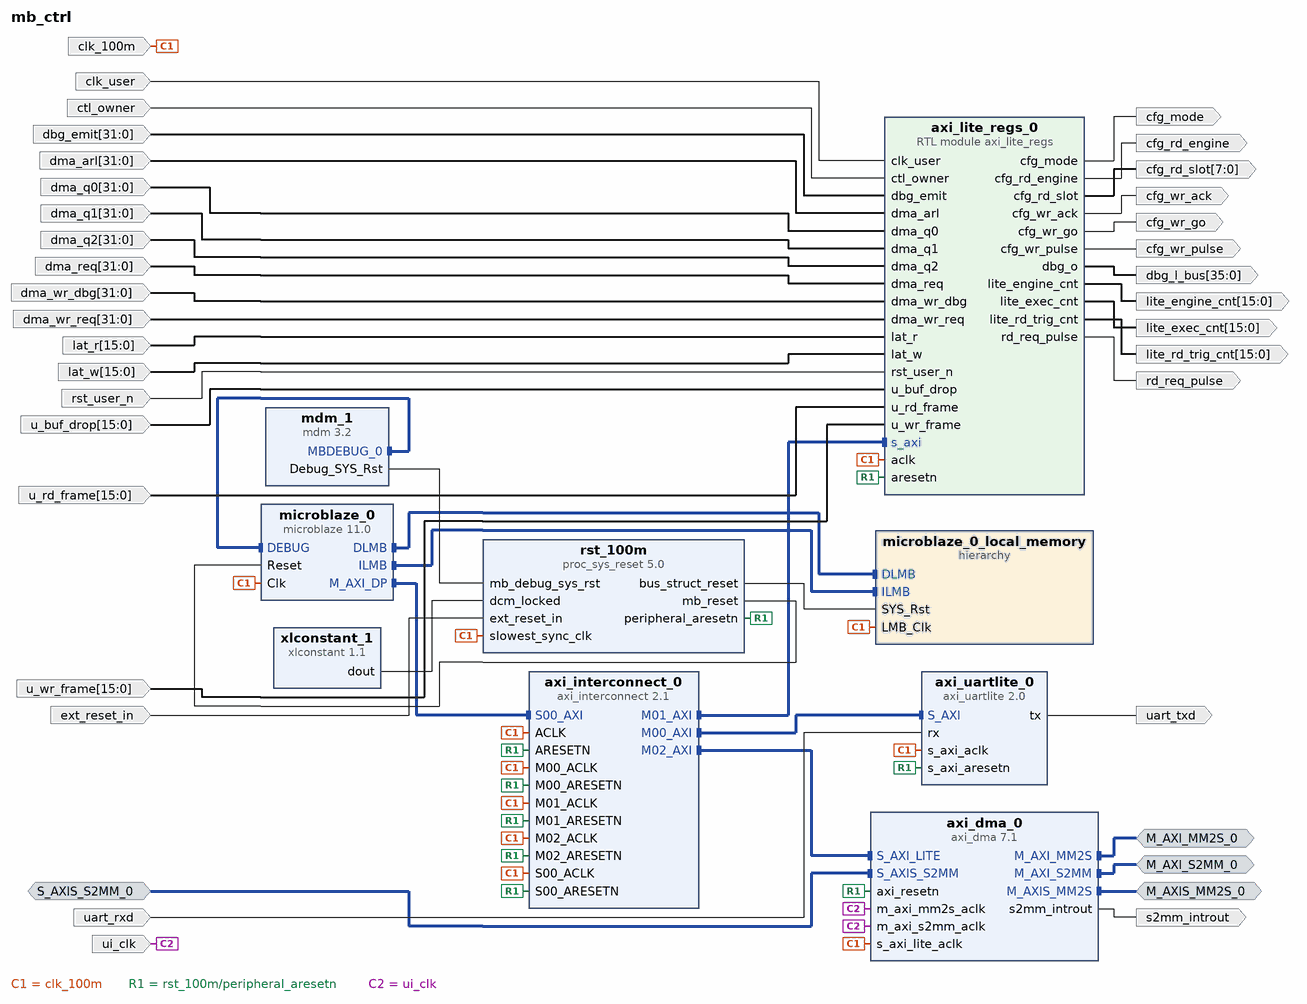
[diagram p0: block diagram of the top level]
# Vivado block design mb_ctrl, xcku060-ffva1156-2-i, Vivado 2023.1
create_bd_design mb_ctrl

create_bd_intf_port -mode Master -vlnv xilinx.com:interface:aximm_rtl:1.0 M_AXI_MM2S_0
set_property -dict [list \
  CONFIG.ADDR_WIDTH 32 \
  CONFIG.DATA_WIDTH 512 \
  CONFIG.FREQ_HZ 300000000 \
  CONFIG.HAS_BRESP 0 \
  CONFIG.HAS_BURST 0 \
  CONFIG.HAS_LOCK 0 \
  CONFIG.HAS_QOS 0 \
  CONFIG.HAS_REGION 0 \
  CONFIG.HAS_WSTRB 0 \
  CONFIG.NUM_READ_OUTSTANDING 16 \
  CONFIG.NUM_WRITE_OUTSTANDING 2 \
  CONFIG.PROTOCOL AXI4 \
  CONFIG.READ_WRITE_MODE READ_ONLY \
] [get_bd_intf_ports M_AXI_MM2S_0]
create_bd_intf_port -mode Master -vlnv xilinx.com:interface:axis_rtl:1.0 M_AXIS_MM2S_0
set_property -dict {CONFIG.FREQ_HZ 300000000} [get_bd_intf_ports M_AXIS_MM2S_0]
create_bd_intf_port -mode Master -vlnv xilinx.com:interface:aximm_rtl:1.0 M_AXI_S2MM_0
set_property -dict [list \
  CONFIG.ADDR_WIDTH 32 \
  CONFIG.DATA_WIDTH 512 \
  CONFIG.FREQ_HZ 300000000 \
  CONFIG.HAS_BURST 0 \
  CONFIG.HAS_LOCK 0 \
  CONFIG.HAS_QOS 0 \
  CONFIG.HAS_REGION 0 \
  CONFIG.HAS_RRESP 0 \
  CONFIG.NUM_READ_OUTSTANDING 2 \
  CONFIG.NUM_WRITE_OUTSTANDING 16 \
  CONFIG.PROTOCOL AXI4 \
  CONFIG.READ_WRITE_MODE WRITE_ONLY \
] [get_bd_intf_ports M_AXI_S2MM_0]
create_bd_intf_port -mode Slave -vlnv xilinx.com:interface:axis_rtl:1.0 S_AXIS_S2MM_0
set_property -dict [list \
  CONFIG.FREQ_HZ 300000000 \
  CONFIG.HAS_TKEEP 1 \
  CONFIG.HAS_TLAST 1 \
  CONFIG.HAS_TREADY 1 \
  CONFIG.HAS_TSTRB 0 \
  CONFIG.LAYERED_METADATA undef \
  CONFIG.TDATA_NUM_BYTES 64 \
  CONFIG.TDEST_WIDTH 0 \
  CONFIG.TID_WIDTH 0 \
  CONFIG.TUSER_WIDTH 0 \
] [get_bd_intf_ports S_AXIS_S2MM_0]
create_bd_port -dir I -type clk clk_100m
set_property -dict {CONFIG.FREQ_HZ 100000000} [get_bd_ports clk_100m]
create_bd_port -dir I -type rst ext_reset_in
set_property -dict {CONFIG.POLARITY ACTIVE_HIGH} [get_bd_ports ext_reset_in]
create_bd_port -dir I uart_rxd
create_bd_port -dir O uart_txd
create_bd_port -dir I -type clk ui_clk
set_property -dict {CONFIG.FREQ_HZ 300000000} [get_bd_ports ui_clk]
create_bd_port -dir O s2mm_introut
create_bd_port -dir I clk_user
create_bd_port -dir I rst_user_n
create_bd_port -dir I -from 15 -to 0 u_wr_frame
create_bd_port -dir I -from 15 -to 0 u_rd_frame
create_bd_port -dir I -from 15 -to 0 u_buf_drop
create_bd_port -dir I ctl_owner
create_bd_port -dir O cfg_mode
create_bd_port -dir O -from 7 -to 0 cfg_rd_slot
create_bd_port -dir O rd_req_pulse
create_bd_port -dir O cfg_wr_pulse
create_bd_port -dir O -from 15 -to 0 lite_exec_cnt
create_bd_port -dir O -from 15 -to 0 lite_rd_trig_cnt
create_bd_port -dir I -from 15 -to 0 lat_w
create_bd_port -dir I -from 15 -to 0 lat_r
create_bd_port -dir I -from 31 -to 0 dma_q0
create_bd_port -dir I -from 31 -to 0 dma_q1
create_bd_port -dir I -from 31 -to 0 dma_q2
create_bd_port -dir O cfg_rd_engine
create_bd_port -dir I -from 31 -to 0 dma_req
create_bd_port -dir I -from 31 -to 0 dma_arl
create_bd_port -dir I -from 31 -to 0 dbg_emit
create_bd_port -dir O -from 15 -to 0 lite_engine_cnt
create_bd_port -dir I -from 31 -to 0 dma_wr_req
create_bd_port -dir I -from 31 -to 0 dma_wr_dbg
create_bd_port -dir O cfg_wr_go
create_bd_port -dir O cfg_wr_ack
create_bd_port -dir O -from 35 -to 0 dbg_l_bus

create_bd_cell -type ip -vlnv xilinx.com:ip:microblaze:11.0 microblaze_0
set_property -dict {CONFIG.C_DEBUG_ENABLED 1 CONFIG.C_D_AXI 1 CONFIG.C_D_LMB 1 CONFIG.C_I_LMB 1} [get_bd_cells microblaze_0]
create_bd_cell -type hier microblaze_0_local_memory
create_bd_cell -type ip -vlnv xilinx.com:ip:mdm:3.2 mdm_1
create_bd_cell -type ip -vlnv xilinx.com:ip:proc_sys_reset:5.0 rst_100m
create_bd_cell -type ip -vlnv xilinx.com:ip:xlconstant:1.1 xlconstant_1
create_bd_cell -type ip -vlnv xilinx.com:ip:axi_interconnect:2.1 axi_interconnect_0
set_property -dict {CONFIG.NUM_MI 3 CONFIG.NUM_SI 1} [get_bd_cells axi_interconnect_0]
create_bd_cell -type ip -vlnv xilinx.com:ip:axi_uartlite:2.0 axi_uartlite_0
set_property -dict {CONFIG.C_BAUDRATE 9600} [get_bd_cells axi_uartlite_0]
create_bd_cell -type module -reference axi_lite_regs axi_lite_regs_0
create_bd_cell -type ip -vlnv xilinx.com:ip:axi_dma:7.1 axi_dma_0
set_property -dict [list \
  CONFIG.c_include_mm2s 1 \
  CONFIG.c_include_s2mm 1 \
  CONFIG.c_include_sg 0 \
  CONFIG.c_m_axi_mm2s_data_width 512 \
  CONFIG.c_m_axi_s2mm_data_width 512 \
  CONFIG.c_m_axis_mm2s_tdata_width 512 \
  CONFIG.c_s_axis_s2mm_tdata_width 512 \
  CONFIG.c_sg_length_width 16 \
] [get_bd_cells axi_dma_0]

# ---- hierarchy /microblaze_0_local_memory ----
current_bd_instance /microblaze_0_local_memory
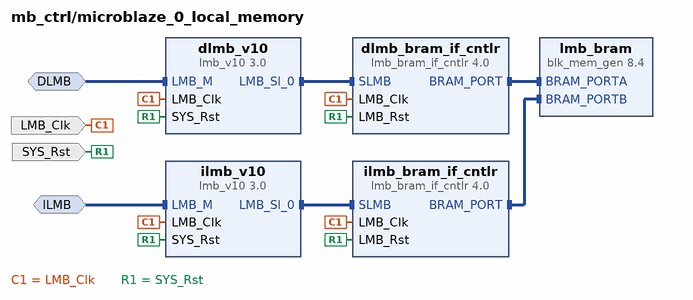
[diagram p1: block diagram inside /microblaze_0_local_memory]
create_bd_intf_pin -mode MirroredMaster -vlnv xilinx.com:interface:lmb_rtl:1.0 DLMB
create_bd_intf_pin -mode MirroredMaster -vlnv xilinx.com:interface:lmb_rtl:1.0 ILMB
create_bd_pin -dir I -type clk LMB_Clk
create_bd_pin -dir I -type rst SYS_Rst

create_bd_cell -type ip -vlnv xilinx.com:ip:lmb_v10:3.0 dlmb_v10
create_bd_cell -type ip -vlnv xilinx.com:ip:lmb_v10:3.0 ilmb_v10
create_bd_cell -type ip -vlnv xilinx.com:ip:lmb_bram_if_cntlr:4.0 dlmb_bram_if_cntlr
set_property -dict {CONFIG.C_ECC 0} [get_bd_cells dlmb_bram_if_cntlr]
create_bd_cell -type ip -vlnv xilinx.com:ip:lmb_bram_if_cntlr:4.0 ilmb_bram_if_cntlr
set_property -dict {CONFIG.C_ECC 0} [get_bd_cells ilmb_bram_if_cntlr]
create_bd_cell -type ip -vlnv xilinx.com:ip:blk_mem_gen:8.4 lmb_bram
set_property -dict {CONFIG.Memory_Type True_Dual_Port_RAM CONFIG.use_bram_block BRAM_Controller} [get_bd_cells lmb_bram]

# ---- connections ----

current_bd_instance /microblaze_0_local_memory
connect_bd_intf_net [get_bd_intf_pins dlmb_v10/LMB_M] [get_bd_intf_pins DLMB]
connect_bd_intf_net [get_bd_intf_pins dlmb_v10/LMB_Sl_0] [get_bd_intf_pins dlmb_bram_if_cntlr/SLMB]
connect_bd_intf_net [get_bd_intf_pins ilmb_v10/LMB_M] [get_bd_intf_pins ILMB]
connect_bd_intf_net [get_bd_intf_pins ilmb_v10/LMB_Sl_0] [get_bd_intf_pins ilmb_bram_if_cntlr/SLMB]
connect_bd_intf_net [get_bd_intf_pins dlmb_bram_if_cntlr/BRAM_PORT] [get_bd_intf_pins lmb_bram/BRAM_PORTA]
connect_bd_intf_net [get_bd_intf_pins ilmb_bram_if_cntlr/BRAM_PORT] [get_bd_intf_pins lmb_bram/BRAM_PORTB]
connect_bd_net [get_bd_pins LMB_Clk] \
  [get_bd_pins dlmb_v10/LMB_Clk] [get_bd_pins dlmb_bram_if_cntlr/LMB_Clk] [get_bd_pins ilmb_v10/LMB_Clk] \
  [get_bd_pins ilmb_bram_if_cntlr/LMB_Clk]
connect_bd_net [get_bd_pins SYS_Rst] \
  [get_bd_pins dlmb_v10/SYS_Rst] [get_bd_pins dlmb_bram_if_cntlr/LMB_Rst] [get_bd_pins ilmb_v10/SYS_Rst] \
  [get_bd_pins ilmb_bram_if_cntlr/LMB_Rst]
set_property HDL_ATTRIBUTE.BMM_INFO_ADDRESS_SPACE {byte  0x00000000 32 > mb_ctrl microblaze_0_local_memory/lmb_bram} [get_bd_cells dlmb_bram_if_cntlr]
set_property HDL_ATTRIBUTE.KEEP_HIERARCHY yes [get_bd_cells dlmb_bram_if_cntlr]

current_bd_instance /
connect_bd_intf_net -intf_net S_AXIS_S2MM_0_1 [get_bd_intf_ports S_AXIS_S2MM_0] [get_bd_intf_pins axi_dma_0/S_AXIS_S2MM]
connect_bd_intf_net [get_bd_intf_ports M_AXIS_MM2S_0] [get_bd_intf_pins axi_dma_0/M_AXIS_MM2S]
connect_bd_intf_net [get_bd_intf_ports M_AXI_MM2S_0] [get_bd_intf_pins axi_dma_0/M_AXI_MM2S]
connect_bd_intf_net [get_bd_intf_ports M_AXI_S2MM_0] [get_bd_intf_pins axi_dma_0/M_AXI_S2MM]
connect_bd_intf_net [get_bd_intf_pins axi_interconnect_0/M00_AXI] [get_bd_intf_pins axi_uartlite_0/S_AXI]
connect_bd_intf_net [get_bd_intf_pins axi_interconnect_0/M01_AXI] [get_bd_intf_pins axi_lite_regs_0/s_axi]
connect_bd_intf_net [get_bd_intf_pins axi_interconnect_0/M02_AXI] [get_bd_intf_pins axi_dma_0/S_AXI_LITE]
connect_bd_intf_net [get_bd_intf_pins mdm_1/MBDEBUG_0] [get_bd_intf_pins microblaze_0/DEBUG]
connect_bd_intf_net [get_bd_intf_pins microblaze_0/DLMB] [get_bd_intf_pins microblaze_0_local_memory/DLMB]
connect_bd_intf_net [get_bd_intf_pins microblaze_0/ILMB] [get_bd_intf_pins microblaze_0_local_memory/ILMB]
connect_bd_intf_net [get_bd_intf_pins microblaze_0/M_AXI_DP] [get_bd_intf_pins axi_interconnect_0/S00_AXI]
connect_bd_net [get_bd_pins axi_dma_0/s2mm_introut] [get_bd_ports s2mm_introut]
connect_bd_net [get_bd_pins axi_lite_regs_0/cfg_mode] [get_bd_ports cfg_mode]
connect_bd_net [get_bd_pins axi_lite_regs_0/cfg_rd_engine] [get_bd_ports cfg_rd_engine]
connect_bd_net [get_bd_pins axi_lite_regs_0/cfg_rd_slot] [get_bd_ports cfg_rd_slot]
connect_bd_net [get_bd_pins axi_lite_regs_0/cfg_wr_ack] [get_bd_ports cfg_wr_ack]
connect_bd_net [get_bd_pins axi_lite_regs_0/cfg_wr_go] [get_bd_ports cfg_wr_go]
connect_bd_net [get_bd_pins axi_lite_regs_0/cfg_wr_pulse] [get_bd_ports cfg_wr_pulse]
connect_bd_net [get_bd_pins axi_lite_regs_0/dbg_o] [get_bd_ports dbg_l_bus]
connect_bd_net [get_bd_pins axi_lite_regs_0/lite_engine_cnt] [get_bd_ports lite_engine_cnt]
connect_bd_net [get_bd_pins axi_lite_regs_0/lite_exec_cnt] [get_bd_ports lite_exec_cnt]
connect_bd_net [get_bd_pins axi_lite_regs_0/lite_rd_trig_cnt] [get_bd_ports lite_rd_trig_cnt]
connect_bd_net [get_bd_pins axi_lite_regs_0/rd_req_pulse] [get_bd_ports rd_req_pulse]
connect_bd_net [get_bd_pins axi_uartlite_0/tx] [get_bd_ports uart_txd]
connect_bd_net [get_bd_ports clk_100m] \
  [get_bd_pins microblaze_0/Clk] [get_bd_pins microblaze_0_local_memory/LMB_Clk] [get_bd_pins rst_100m/slowest_sync_clk] \
  [get_bd_pins axi_interconnect_0/ACLK] [get_bd_pins axi_interconnect_0/S00_ACLK] [get_bd_pins axi_interconnect_0/M00_ACLK] \
  [get_bd_pins axi_interconnect_0/M01_ACLK] [get_bd_pins axi_uartlite_0/s_axi_aclk] [get_bd_pins axi_lite_regs_0/aclk] \
  [get_bd_pins axi_interconnect_0/M02_ACLK] [get_bd_pins axi_dma_0/s_axi_lite_aclk]
connect_bd_net -net clk_user_0_1 [get_bd_ports clk_user] [get_bd_pins axi_lite_regs_0/clk_user]
connect_bd_net -net ctl_owner_0_1 [get_bd_ports ctl_owner] [get_bd_pins axi_lite_regs_0/ctl_owner]
connect_bd_net -net dbg_emit_0_1 [get_bd_ports dbg_emit] [get_bd_pins axi_lite_regs_0/dbg_emit]
connect_bd_net -net dma_arl_0_1 [get_bd_ports dma_arl] [get_bd_pins axi_lite_regs_0/dma_arl]
connect_bd_net -net dma_q0_0_1 [get_bd_ports dma_q0] [get_bd_pins axi_lite_regs_0/dma_q0]
connect_bd_net -net dma_q1_0_1 [get_bd_ports dma_q1] [get_bd_pins axi_lite_regs_0/dma_q1]
connect_bd_net -net dma_q2_0_1 [get_bd_ports dma_q2] [get_bd_pins axi_lite_regs_0/dma_q2]
connect_bd_net -net dma_req_0_1 [get_bd_ports dma_req] [get_bd_pins axi_lite_regs_0/dma_req]
connect_bd_net -net dma_wr_dbg_0_1 [get_bd_ports dma_wr_dbg] [get_bd_pins axi_lite_regs_0/dma_wr_dbg]
connect_bd_net -net dma_wr_req_0_1 [get_bd_ports dma_wr_req] [get_bd_pins axi_lite_regs_0/dma_wr_req]
connect_bd_net [get_bd_ports ext_reset_in] [get_bd_pins rst_100m/ext_reset_in]
connect_bd_net -net lat_r_0_1 [get_bd_ports lat_r] [get_bd_pins axi_lite_regs_0/lat_r]
connect_bd_net -net lat_w_0_1 [get_bd_ports lat_w] [get_bd_pins axi_lite_regs_0/lat_w]
connect_bd_net [get_bd_pins mdm_1/Debug_SYS_Rst] [get_bd_pins rst_100m/mb_debug_sys_rst]
connect_bd_net [get_bd_pins rst_100m/bus_struct_reset] [get_bd_pins microblaze_0_local_memory/SYS_Rst]
connect_bd_net [get_bd_pins rst_100m/mb_reset] [get_bd_pins microblaze_0/Reset]
connect_bd_net [get_bd_pins rst_100m/peripheral_aresetn] \
  [get_bd_pins axi_interconnect_0/ARESETN] [get_bd_pins axi_interconnect_0/S00_ARESETN] \
  [get_bd_pins axi_interconnect_0/M00_ARESETN] [get_bd_pins axi_interconnect_0/M01_ARESETN] \
  [get_bd_pins axi_uartlite_0/s_axi_aresetn] [get_bd_pins axi_lite_regs_0/aresetn] \
  [get_bd_pins axi_interconnect_0/M02_ARESETN] [get_bd_pins axi_dma_0/axi_resetn]
connect_bd_net -net rst_user_n_0_1 [get_bd_ports rst_user_n] [get_bd_pins axi_lite_regs_0/rst_user_n]
connect_bd_net -net u_buf_drop_0_1 [get_bd_ports u_buf_drop] [get_bd_pins axi_lite_regs_0/u_buf_drop]
connect_bd_net -net u_rd_frame_0_1 [get_bd_ports u_rd_frame] [get_bd_pins axi_lite_regs_0/u_rd_frame]
connect_bd_net -net u_wr_frame_0_1 [get_bd_ports u_wr_frame] [get_bd_pins axi_lite_regs_0/u_wr_frame]
connect_bd_net [get_bd_ports uart_rxd] [get_bd_pins axi_uartlite_0/rx]
connect_bd_net [get_bd_ports ui_clk] [get_bd_pins axi_dma_0/m_axi_mm2s_aclk] [get_bd_pins axi_dma_0/m_axi_s2mm_aclk]
connect_bd_net [get_bd_pins xlconstant_1/dout] [get_bd_pins rst_100m/dcm_locked]
set_property HDL_ATTRIBUTE.BMM_INFO_PROCESSOR {microblaze-le > mb_ctrl microblaze_0_local_memory/dlmb_bram_if_cntlr} [get_bd_cells microblaze_0]
set_property HDL_ATTRIBUTE.KEEP_HIERARCHY yes [get_bd_cells microblaze_0]

# ---- address map ----
assign_bd_address -offset 0x00000000 -range 64K -target_address_space [get_bd_addr_spaces microblaze_0/Data] [get_bd_addr_segs microblaze_0_local_memory/dlmb_bram_if_cntlr/SLMB/Mem]
assign_bd_address -offset 0x40600000 -range 64K -target_address_space [get_bd_addr_spaces microblaze_0/Data] [get_bd_addr_segs axi_uartlite_0/S_AXI/Reg]
assign_bd_address -offset 0x44A00000 -range 4K -target_address_space [get_bd_addr_spaces microblaze_0/Data] [get_bd_addr_segs axi_lite_regs_0/s_axi/reg0]
assign_bd_address -offset 0x44A10000 -range 4K -target_address_space [get_bd_addr_spaces microblaze_0/Data] [get_bd_addr_segs axi_dma_0/S_AXI_LITE/Reg]
assign_bd_address -offset 0x00000000 -range 64K -target_address_space [get_bd_addr_spaces microblaze_0/Instruction] [get_bd_addr_segs microblaze_0_local_memory/ilmb_bram_if_cntlr/SLMB/Mem]

validate_bd_design
save_bd_design
